# Altium schematic sheet Sheet1.SchDoc: =Projectname
size A4; SheetNumber: 1; SheetTotal: 1
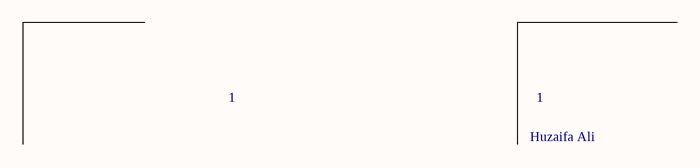
[diagram p0: Sheet1.SchDoc]

## Notes on the sheet
- 1
- Huzaifa Ali